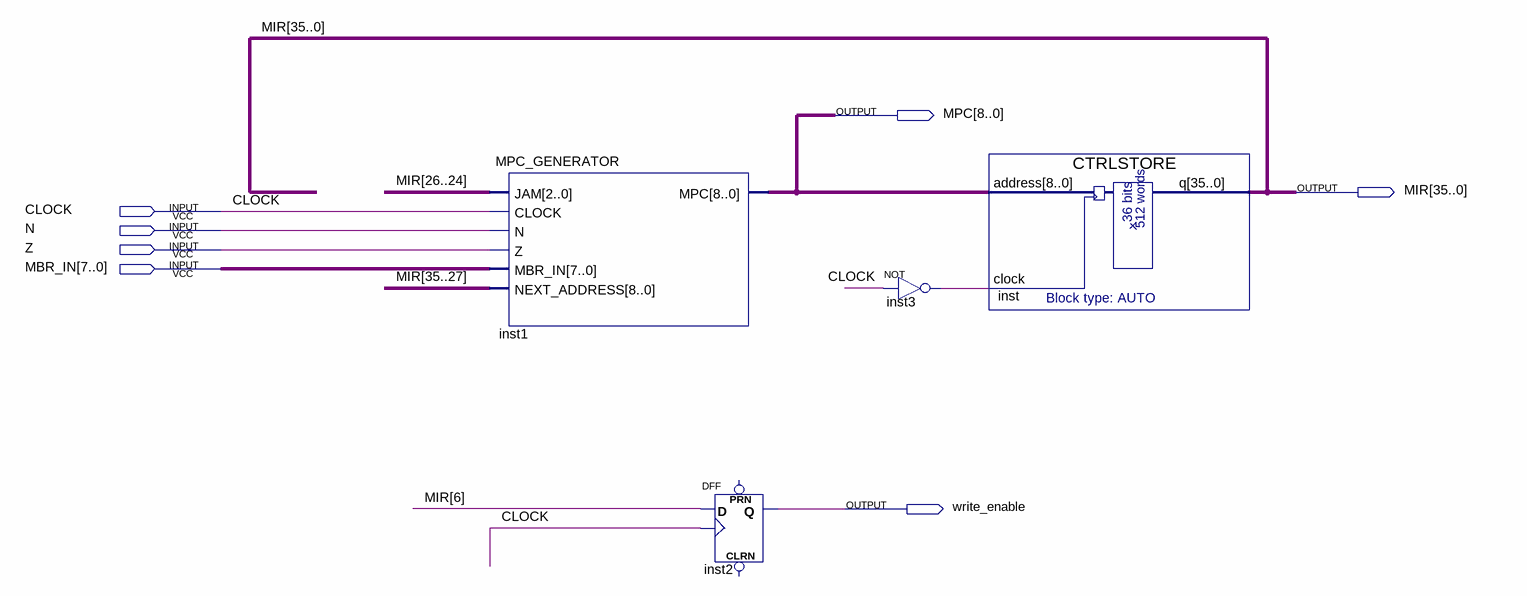
[diagram p0: schematic sheet]
// Quartus schematic CONTROL_UNIT.bdf as structural Verilog: 4 symbols, 7 pins
module CONTROL_UNIT (
  input  CLOCK,
  input  N,
  input  Z,
  input  [7:0] MBR_IN,
  output [8:0] MPC,
  output [35:0] MIR,
  output write_enable
);

  wire inst3_out;

  MPC_GENERATOR inst1 (
    .JAM(MIR[26:24]), .CLOCK(CLOCK), .N(N), .Z(Z), .MBR_IN(MBR_IN), .NEXT_ADDRESS(MIR[35:27]), .MPC(MPC));
  DFF inst2 (.CLK(CLOCK), .D(MIR[6]), .Q(write_enable));  // open: CLRN, PRN
  not inst3 (inst3_out, CLOCK);
  CTRLSTORE inst (.address(MPC), .clock(inst3_out), .q(MIR));
endmodule
